# Altium schematic sheet P2_TOP.SchDoc
size A4; SheetNumber: 1; SheetTotal: 9
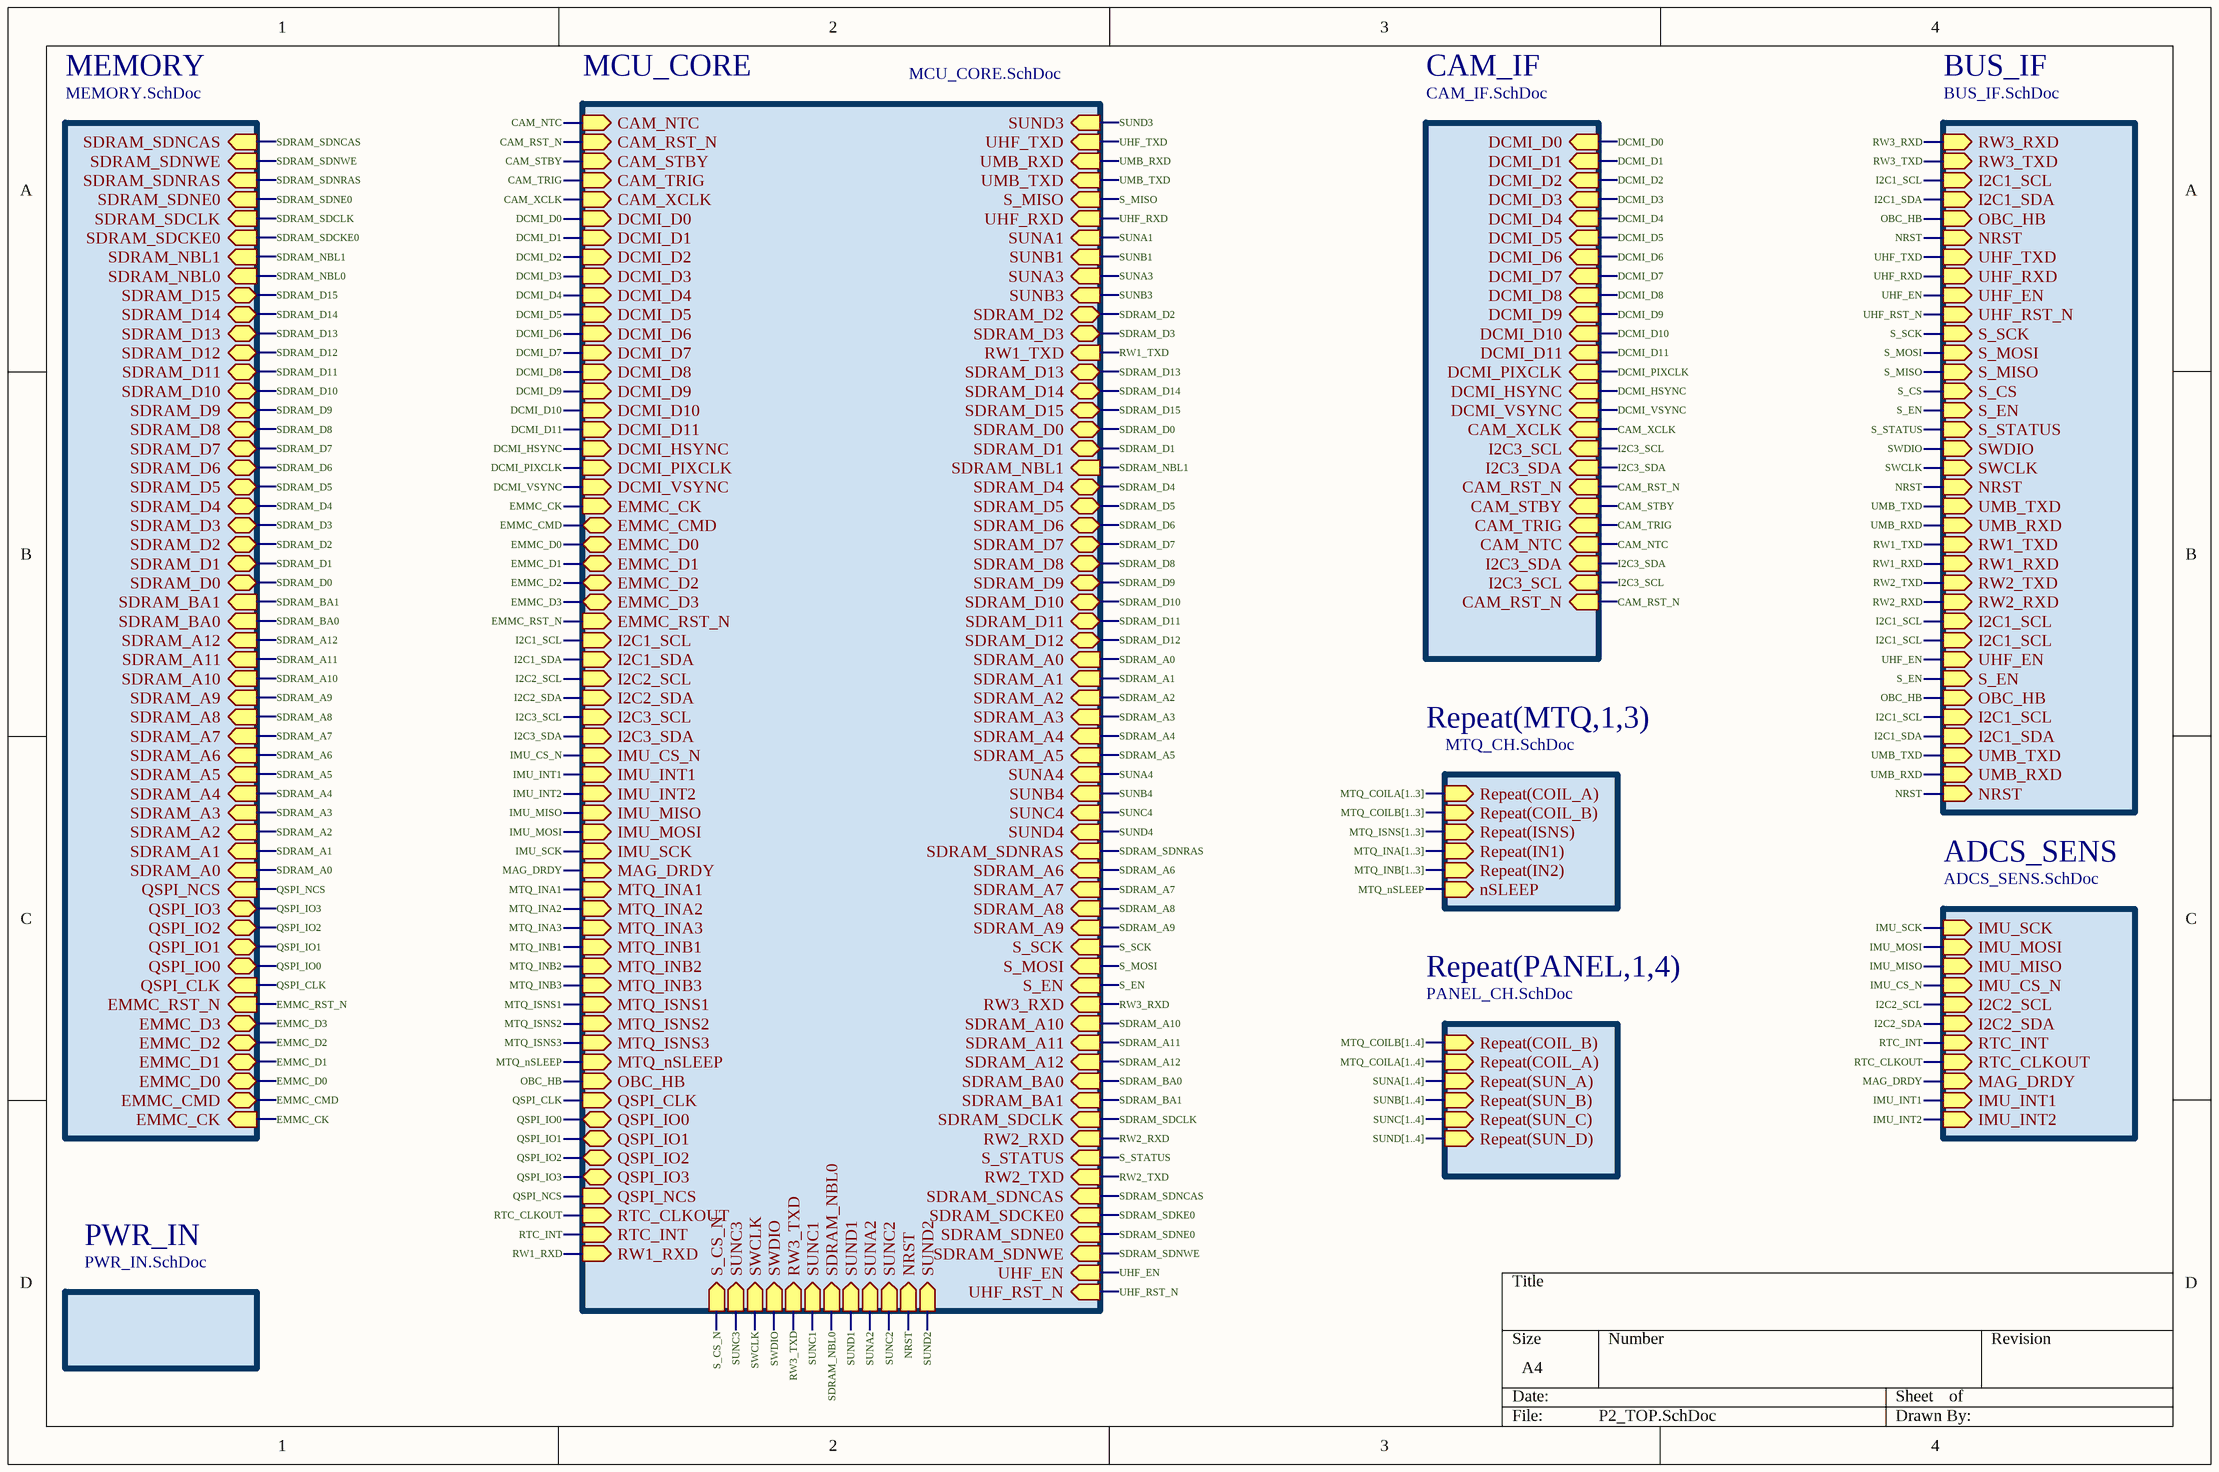
[diagram p0: P2_TOP.SchDoc]

## Sub-sheets
ADCS_SENS = ADCS_SENS.SchDoc: IMU_SCK (in), IMU_MOSI (in), IMU_MISO (in), IMU_CS_N (in), I2C2_SCL (in), I2C2_SDA (in), RTC_INT (in), RTC_CLKOUT (in), MAG_DRDY (in), IMU_INT1 (in), IMU_INT2 (in)
BUS_IF = BUS_IF.SchDoc: RW3_RXD (in), RW3_TXD (in), I2C1_SCL (in), I2C1_SDA (in), OBC_HB (in), NRST (in), UHF_TXD (in), UHF_RXD (in), UHF_EN (in), UHF_RST_N (in), S_SCK (in), S_MOSI (in), S_MISO (in), S_CS (in), S_EN (in), S_STATUS (in), SWDIO (in), SWCLK (in), NRST (in), UMB_TXD (in), UMB_RXD (in), RW1_TXD (in), RW1_RXD (in), RW2_TXD (in), RW2_RXD (in), I2C1_SCL (in), I2C1_SCL (in), UHF_EN (in), S_EN (in), OBC_HB (in), I2C1_SCL (in), I2C1_SDA (in), UMB_TXD (in), UMB_RXD (in), NRST (in)
CAM_IF = CAM_IF.SchDoc: DCMI_D0 (in), DCMI_D1 (in), DCMI_D2 (in), DCMI_D3 (in), DCMI_D4 (in), DCMI_D5 (in), DCMI_D6 (in), DCMI_D7 (in), DCMI_D8 (in), DCMI_D9 (in), DCMI_D10 (in), DCMI_D11 (in), DCMI_PIXCLK (in), DCMI_HSYNC (in), DCMI_VSYNC (in), CAM_XCLK (in), I2C3_SCL (in), I2C3_SDA (in), CAM_RST_N (in), CAM_STBY (in), CAM_TRIG (in), CAM_NTC (in), I2C3_SDA (in), I2C3_SCL (in), CAM_RST_N (in)
MCU_CORE = MCU_CORE.SchDoc: CAM_NTC (in), CAM_RST_N (in), CAM_STBY (in), CAM_TRIG (in), CAM_XCLK (in), DCMI_D0 (in), DCMI_D1 (in), DCMI_D2 (in), DCMI_D3 (in), DCMI_D4 (in), DCMI_D5 (in), DCMI_D6 (in), DCMI_D7 (in), DCMI_D8 (in), DCMI_D9 (in), DCMI_D10 (in), DCMI_D11 (in), DCMI_HSYNC (in), DCMI_PIXCLK (in), DCMI_VSYNC (in), EMMC_CK (in), EMMC_CMD (bidir), EMMC_D0 (bidir), EMMC_D1 (bidir), EMMC_D2 (bidir), EMMC_D3 (bidir), EMMC_RST_N (in), I2C1_SCL (in), I2C1_SDA (in), I2C2_SCL (in), I2C2_SDA (in), I2C3_SCL (in), I2C3_SDA (in), IMU_CS_N (in), IMU_INT1 (in), IMU_INT2 (in), IMU_MISO (in), IMU_MOSI (in), IMU_SCK (in), MAG_DRDY (in), MTQ_INA1 (in), MTQ_INA2 (in), MTQ_INA3 (in), MTQ_INB1 (in), MTQ_INB2 (in), MTQ_INB3 (in), MTQ_ISNS1 (in), MTQ_ISNS2 (in), MTQ_ISNS3 (in), MTQ_nSLEEP (in), SUND3 (in), UHF_TXD (in), UMB_RXD (in), UMB_TXD (in), S_MISO (in), UHF_RXD (in), SUNA1 (in), SUNB1 (in), SUNA3 (in), SUNB3 (in), SDRAM_D2 (bidir), SDRAM_D3 (bidir), RW1_TXD (in), SDRAM_D13 (bidir), SDRAM_D14 (bidir), SDRAM_D15 (bidir), SDRAM_D0 (bidir), SDRAM_D1 (bidir), SDRAM_NBL1 (in), SDRAM_D4 (bidir), SDRAM_D5 (bidir), SDRAM_D6 (bidir), SDRAM_D7 (bidir), SDRAM_D8 (bidir), SDRAM_D9 (bidir), SDRAM_D10 (bidir), SDRAM_D11 (bidir), SDRAM_D12 (bidir), SDRAM_A0 (in), SDRAM_A1 (in), SDRAM_A2 (in), SDRAM_A3 (in), SDRAM_A4 (in), SDRAM_A5 (in), SUNA4 (in), SUNB4 (in), SUNC4 (in), SUND4 (in), SDRAM_SDNRAS (in), SDRAM_A6 (in), SDRAM_A7 (in), SDRAM_A8 (in), SDRAM_A9 (in), S_SCK (in), S_MOSI (in), S_EN (in), RW3_RXD (in), SDRAM_A10 (in), SDRAM_A11 (in), SDRAM_A12 (in), SDRAM_BA0 (in), SDRAM_BA1 (in), SDRAM_SDCLK (in), RW2_RXD (in), S_STATUS (in), RW2_TXD (in), SDRAM_SDNCAS (in), SDRAM_SDCKE0 (in), SDRAM_SDNE0 (in), SDRAM_SDNWE (in), UHF_EN (in), UHF_RST_N (in), OBC_HB (in), QSPI_CLK (in), QSPI_IO0 (bidir), QSPI_IO1 (bidir), QSPI_IO2 (bidir), QSPI_IO3 (bidir), QSPI_NCS (in), RTC_CLKOUT (in), RTC_INT (in), RW1_RXD (in), SUNC1 (in), SDRAM_NBL0 (in), SUND1 (in), SUNA2 (in), SUNC2 (in), NRST (in), SUND2 (in), RW3_TXD (in), SWDIO (in), SWCLK (in), SUNC3 (in), S_CS_N (in)
MEMORY = MEMORY.SchDoc: SDRAM_SDNWE (in), SDRAM_SDNRAS (in), SDRAM_SDNE0 (in), SDRAM_SDCLK (in), SDRAM_SDCKE0 (in), SDRAM_NBL1 (in), SDRAM_NBL0 (in), SDRAM_D15 (bidir), SDRAM_D14 (bidir), SDRAM_D13 (bidir), SDRAM_D12 (bidir), SDRAM_D11 (bidir), SDRAM_D10 (bidir), SDRAM_D9 (bidir), SDRAM_D8 (bidir), SDRAM_D7 (bidir), SDRAM_D6 (bidir), SDRAM_D5 (bidir), SDRAM_D4 (bidir), SDRAM_D3 (bidir), SDRAM_D2 (bidir), SDRAM_D1 (bidir), SDRAM_D0 (bidir), SDRAM_BA1 (in), SDRAM_BA0 (in), SDRAM_A12 (in), SDRAM_A11 (in), SDRAM_A10 (in), SDRAM_A9 (in), SDRAM_A8 (in), SDRAM_A7 (in), SDRAM_A6 (in), SDRAM_A5 (in), SDRAM_A4 (in), SDRAM_A3 (in), SDRAM_A2 (in), SDRAM_A1 (in), SDRAM_A0 (in), QSPI_NCS (in), QSPI_IO3 (bidir), QSPI_IO2 (bidir), QSPI_IO1 (bidir), QSPI_IO0 (bidir), QSPI_CLK (in), EMMC_RST_N (in), EMMC_D3 (bidir), EMMC_D2 (bidir), EMMC_D1 (bidir), EMMC_D0 (bidir), EMMC_CK (in), EMMC_CMD (bidir), SDRAM_SDNCAS (in)
PWR_IN = PWR_IN.SchDoc: no entries
Repeat(MTQ,1,3) = MTQ_CH.SchDoc: Repeat(COIL_A) (in), Repeat(COIL_B) (in), Repeat(ISNS) (in), Repeat(IN1) (in), Repeat(IN2) (in), nSLEEP (in)
Repeat(PANEL,1,4) = PANEL_CH.SchDoc: Repeat(COIL_B) (in), Repeat(COIL_A) (in), Repeat(SUN_A) (in), Repeat(SUN_B) (in), Repeat(SUN_C) (in), Repeat(SUN_D) (in)

## Nets
CAM_NTC: sheet CAM_IF/CAM_NTC, sheet MCU_CORE/CAM_NTC
CAM_RST_N: sheet CAM_IF/CAM_RST_N, sheet CAM_IF/CAM_RST_N, sheet MCU_CORE/CAM_RST_N
CAM_STBY: sheet CAM_IF/CAM_STBY, sheet MCU_CORE/CAM_STBY
CAM_TRIG: sheet CAM_IF/CAM_TRIG, sheet MCU_CORE/CAM_TRIG
CAM_XCLK: sheet CAM_IF/CAM_XCLK, sheet MCU_CORE/CAM_XCLK
DCMI_D0: sheet CAM_IF/DCMI_D0, sheet MCU_CORE/DCMI_D0
DCMI_D1: sheet CAM_IF/DCMI_D1, sheet MCU_CORE/DCMI_D1
DCMI_D2: sheet CAM_IF/DCMI_D2, sheet MCU_CORE/DCMI_D2
DCMI_D3: sheet CAM_IF/DCMI_D3, sheet MCU_CORE/DCMI_D3
DCMI_D4: sheet CAM_IF/DCMI_D4, sheet MCU_CORE/DCMI_D4
DCMI_D5: sheet CAM_IF/DCMI_D5, sheet MCU_CORE/DCMI_D5
DCMI_D6: sheet CAM_IF/DCMI_D6, sheet MCU_CORE/DCMI_D6
DCMI_D7: sheet CAM_IF/DCMI_D7, sheet MCU_CORE/DCMI_D7
DCMI_D8: sheet CAM_IF/DCMI_D8, sheet MCU_CORE/DCMI_D8
DCMI_D9: sheet CAM_IF/DCMI_D9, sheet MCU_CORE/DCMI_D9
DCMI_D10: sheet CAM_IF/DCMI_D10, sheet MCU_CORE/DCMI_D10
DCMI_D11: sheet CAM_IF/DCMI_D11, sheet MCU_CORE/DCMI_D11
DCMI_HSYNC: sheet CAM_IF/DCMI_HSYNC, sheet MCU_CORE/DCMI_HSYNC
DCMI_PIXCLK: sheet CAM_IF/DCMI_PIXCLK, sheet MCU_CORE/DCMI_PIXCLK
DCMI_VSYNC: sheet CAM_IF/DCMI_VSYNC, sheet MCU_CORE/DCMI_VSYNC
EMMC_CK: sheet MEMORY/EMMC_CK, sheet MCU_CORE/EMMC_CK
EMMC_CMD: sheet MEMORY/EMMC_CMD, sheet MCU_CORE/EMMC_CMD
EMMC_D0: sheet MEMORY/EMMC_D0, sheet MCU_CORE/EMMC_D0
EMMC_D1: sheet MEMORY/EMMC_D1, sheet MCU_CORE/EMMC_D1
EMMC_D2: sheet MEMORY/EMMC_D2, sheet MCU_CORE/EMMC_D2
EMMC_D3: sheet MEMORY/EMMC_D3, sheet MCU_CORE/EMMC_D3
EMMC_RST_N: sheet MEMORY/EMMC_RST_N, sheet MCU_CORE/EMMC_RST_N
I2C1_SCL: sheet MCU_CORE/I2C1_SCL, sheet BUS_IF/I2C1_SCL, sheet BUS_IF/I2C1_SCL, sheet BUS_IF/I2C1_SCL, sheet BUS_IF/I2C1_SCL
I2C1_SDA: sheet MCU_CORE/I2C1_SDA, sheet BUS_IF/I2C1_SDA, sheet BUS_IF/I2C1_SDA
I2C2_SCL: sheet MCU_CORE/I2C2_SCL, sheet ADCS_SENS/I2C2_SCL
I2C2_SDA: sheet MCU_CORE/I2C2_SDA, sheet ADCS_SENS/I2C2_SDA
I2C3_SCL: sheet CAM_IF/I2C3_SCL, sheet CAM_IF/I2C3_SCL, sheet MCU_CORE/I2C3_SCL
I2C3_SDA: sheet CAM_IF/I2C3_SDA, sheet CAM_IF/I2C3_SDA, sheet MCU_CORE/I2C3_SDA
IMU_CS_N: sheet MCU_CORE/IMU_CS_N, sheet ADCS_SENS/IMU_CS_N
IMU_INT1: sheet MCU_CORE/IMU_INT1, sheet ADCS_SENS/IMU_INT1
IMU_INT2: sheet MCU_CORE/IMU_INT2, sheet ADCS_SENS/IMU_INT2
IMU_MISO: sheet MCU_CORE/IMU_MISO, sheet ADCS_SENS/IMU_MISO
IMU_MOSI: sheet MCU_CORE/IMU_MOSI, sheet ADCS_SENS/IMU_MOSI
IMU_SCK: sheet MCU_CORE/IMU_SCK, sheet ADCS_SENS/IMU_SCK
MAG_DRDY: sheet MCU_CORE/MAG_DRDY, sheet ADCS_SENS/MAG_DRDY
MTQ_INA1: sheet MCU_CORE/MTQ_INA1
MTQ_INA2: sheet MCU_CORE/MTQ_INA2
MTQ_INA3: sheet MCU_CORE/MTQ_INA3
MTQ_INB1: sheet MCU_CORE/MTQ_INB1
MTQ_INB2: sheet MCU_CORE/MTQ_INB2
MTQ_INB3: sheet MCU_CORE/MTQ_INB3
MTQ_ISNS1: sheet MCU_CORE/MTQ_ISNS1
MTQ_ISNS2: sheet MCU_CORE/MTQ_ISNS2
MTQ_ISNS3: sheet MCU_CORE/MTQ_ISNS3
MTQ_nSLEEP: sheet MCU_CORE/MTQ_nSLEEP, sheet Repeat(MTQ,1,3)/nSLEEP
NRST: sheet MCU_CORE/NRST, sheet BUS_IF/NRST, sheet BUS_IF/NRST, sheet BUS_IF/NRST
OBC_HB: sheet MCU_CORE/OBC_HB, sheet BUS_IF/OBC_HB, sheet BUS_IF/OBC_HB
QSPI_CLK: sheet MEMORY/QSPI_CLK, sheet MCU_CORE/QSPI_CLK
QSPI_IO0: sheet MEMORY/QSPI_IO0, sheet MCU_CORE/QSPI_IO0
QSPI_IO1: sheet MEMORY/QSPI_IO1, sheet MCU_CORE/QSPI_IO1
QSPI_IO2: sheet MEMORY/QSPI_IO2, sheet MCU_CORE/QSPI_IO2
QSPI_IO3: sheet MEMORY/QSPI_IO3, sheet MCU_CORE/QSPI_IO3
QSPI_NCS: sheet MEMORY/QSPI_NCS, sheet MCU_CORE/QSPI_NCS
RTC_CLKOUT: sheet MCU_CORE/RTC_CLKOUT, sheet ADCS_SENS/RTC_CLKOUT
RTC_INT: sheet MCU_CORE/RTC_INT, sheet ADCS_SENS/RTC_INT
RW1_RXD: sheet MCU_CORE/RW1_RXD, sheet BUS_IF/RW1_RXD
RW1_TXD: sheet MCU_CORE/RW1_TXD, sheet BUS_IF/RW1_TXD
RW2_RXD: sheet MCU_CORE/RW2_RXD, sheet BUS_IF/RW2_RXD
RW2_TXD: sheet MCU_CORE/RW2_TXD, sheet BUS_IF/RW2_TXD
RW3_RXD: sheet MCU_CORE/RW3_RXD, sheet BUS_IF/RW3_RXD
RW3_TXD: sheet MCU_CORE/RW3_TXD, sheet BUS_IF/RW3_TXD
S_CS: sheet BUS_IF/S_CS
S_CS_N: sheet MCU_CORE/S_CS_N
S_EN: sheet MCU_CORE/S_EN, sheet BUS_IF/S_EN, sheet BUS_IF/S_EN
S_MISO: sheet MCU_CORE/S_MISO, sheet BUS_IF/S_MISO
S_MOSI: sheet MCU_CORE/S_MOSI, sheet BUS_IF/S_MOSI
S_SCK: sheet MCU_CORE/S_SCK, sheet BUS_IF/S_SCK
S_STATUS: sheet MCU_CORE/S_STATUS, sheet BUS_IF/S_STATUS
SDRAM_A0: sheet MEMORY/SDRAM_A0, sheet MCU_CORE/SDRAM_A0
SDRAM_A1: sheet MEMORY/SDRAM_A1, sheet MCU_CORE/SDRAM_A1
SDRAM_A2: sheet MEMORY/SDRAM_A2, sheet MCU_CORE/SDRAM_A2
SDRAM_A3: sheet MEMORY/SDRAM_A3, sheet MCU_CORE/SDRAM_A3
SDRAM_A4: sheet MEMORY/SDRAM_A4, sheet MCU_CORE/SDRAM_A4
SDRAM_A5: sheet MEMORY/SDRAM_A5, sheet MCU_CORE/SDRAM_A5
SDRAM_A6: sheet MEMORY/SDRAM_A6, sheet MCU_CORE/SDRAM_A6
SDRAM_A7: sheet MEMORY/SDRAM_A7, sheet MCU_CORE/SDRAM_A7
SDRAM_A8: sheet MEMORY/SDRAM_A8, sheet MCU_CORE/SDRAM_A8
SDRAM_A9: sheet MEMORY/SDRAM_A9, sheet MCU_CORE/SDRAM_A9
SDRAM_A10: sheet MEMORY/SDRAM_A10, sheet MCU_CORE/SDRAM_A10
SDRAM_A11: sheet MEMORY/SDRAM_A11, sheet MCU_CORE/SDRAM_A11
SDRAM_A12: sheet MEMORY/SDRAM_A12, sheet MCU_CORE/SDRAM_A12
SDRAM_BA0: sheet MEMORY/SDRAM_BA0, sheet MCU_CORE/SDRAM_BA0
SDRAM_BA1: sheet MEMORY/SDRAM_BA1, sheet MCU_CORE/SDRAM_BA1
SDRAM_D0: sheet MEMORY/SDRAM_D0, sheet MCU_CORE/SDRAM_D0
SDRAM_D1: sheet MEMORY/SDRAM_D1, sheet MCU_CORE/SDRAM_D1
SDRAM_D2: sheet MEMORY/SDRAM_D2, sheet MCU_CORE/SDRAM_D2
SDRAM_D3: sheet MEMORY/SDRAM_D3, sheet MCU_CORE/SDRAM_D3
SDRAM_D4: sheet MEMORY/SDRAM_D4, sheet MCU_CORE/SDRAM_D4
SDRAM_D5: sheet MEMORY/SDRAM_D5, sheet MCU_CORE/SDRAM_D5
SDRAM_D6: sheet MEMORY/SDRAM_D6, sheet MCU_CORE/SDRAM_D6
SDRAM_D7: sheet MEMORY/SDRAM_D7, sheet MCU_CORE/SDRAM_D7
SDRAM_D8: sheet MEMORY/SDRAM_D8, sheet MCU_CORE/SDRAM_D8
SDRAM_D9: sheet MEMORY/SDRAM_D9, sheet MCU_CORE/SDRAM_D9
SDRAM_D10: sheet MEMORY/SDRAM_D10, sheet MCU_CORE/SDRAM_D10
SDRAM_D11: sheet MEMORY/SDRAM_D11, sheet MCU_CORE/SDRAM_D11
SDRAM_D12: sheet MEMORY/SDRAM_D12, sheet MCU_CORE/SDRAM_D12
SDRAM_D13: sheet MEMORY/SDRAM_D13, sheet MCU_CORE/SDRAM_D13
SDRAM_D14: sheet MEMORY/SDRAM_D14, sheet MCU_CORE/SDRAM_D14
SDRAM_D15: sheet MEMORY/SDRAM_D15, sheet MCU_CORE/SDRAM_D15
SDRAM_NBL0: sheet MEMORY/SDRAM_NBL0, sheet MCU_CORE/SDRAM_NBL0
SDRAM_NBL1: sheet MEMORY/SDRAM_NBL1, sheet MCU_CORE/SDRAM_NBL1
SDRAM_SDCKE0: sheet MEMORY/SDRAM_SDCKE0
SDRAM_SDCLK: sheet MEMORY/SDRAM_SDCLK, sheet MCU_CORE/SDRAM_SDCLK
SDRAM_SDKE0: sheet MCU_CORE/SDRAM_SDCKE0
SDRAM_SDNCAS: sheet MEMORY/SDRAM_SDNCAS, sheet MCU_CORE/SDRAM_SDNCAS
SDRAM_SDNE0: sheet MEMORY/SDRAM_SDNE0, sheet MCU_CORE/SDRAM_SDNE0
SDRAM_SDNRAS: sheet MEMORY/SDRAM_SDNRAS, sheet MCU_CORE/SDRAM_SDNRAS
SDRAM_SDNWE: sheet MEMORY/SDRAM_SDNWE, sheet MCU_CORE/SDRAM_SDNWE
SUNA1: sheet MCU_CORE/SUNA1
SUNA2: sheet MCU_CORE/SUNA2
SUNA3: sheet MCU_CORE/SUNA3
SUNA4: sheet MCU_CORE/SUNA4
SUNB1: sheet MCU_CORE/SUNB1
SUNB3: sheet MCU_CORE/SUNB3
SUNB4: sheet MCU_CORE/SUNB4
SUNC1: sheet MCU_CORE/SUNC1
SUNC2: sheet MCU_CORE/SUNC2
SUNC3: sheet MCU_CORE/SUNC3
SUNC4: sheet MCU_CORE/SUNC4
SUND1: sheet MCU_CORE/SUND1
SUND2: sheet MCU_CORE/SUND2
SUND3: sheet MCU_CORE/SUND3
SUND4: sheet MCU_CORE/SUND4
SWCLK: sheet MCU_CORE/SWCLK, sheet BUS_IF/SWCLK
SWDIO: sheet MCU_CORE/SWDIO, sheet BUS_IF/SWDIO
UHF_EN: sheet MCU_CORE/UHF_EN, sheet BUS_IF/UHF_EN, sheet BUS_IF/UHF_EN
UHF_RST_N: sheet MCU_CORE/UHF_RST_N, sheet BUS_IF/UHF_RST_N
UHF_RXD: sheet MCU_CORE/UHF_RXD, sheet BUS_IF/UHF_RXD
UHF_TXD: sheet MCU_CORE/UHF_TXD, sheet BUS_IF/UHF_TXD
UMB_RXD: sheet MCU_CORE/UMB_RXD, sheet BUS_IF/UMB_RXD, sheet BUS_IF/UMB_RXD
UMB_TXD: sheet MCU_CORE/UMB_TXD, sheet BUS_IF/UMB_TXD, sheet BUS_IF/UMB_TXD

## Buses and harness runs
bus MTQ_COILA[1..3] = sheet Repeat(MTQ,1,3)/Repeat(COIL_A)
bus MTQ_COILA[1..4] = sheet Repeat(PANEL,1,4)/Repeat(COIL_A)
bus MTQ_COILB[1..3] = sheet Repeat(MTQ,1,3)/Repeat(COIL_B)
bus MTQ_COILB[1..4] = sheet Repeat(PANEL,1,4)/Repeat(COIL_B)
bus MTQ_INA[1..3] = sheet Repeat(MTQ,1,3)/Repeat(IN1)
bus MTQ_INB[1..3] = sheet Repeat(MTQ,1,3)/Repeat(IN2)
bus MTQ_ISNS[1..3] = sheet Repeat(MTQ,1,3)/Repeat(ISNS)
bus SUNA[1..4] = sheet Repeat(PANEL,1,4)/Repeat(SUN_A)
bus SUNB[1..4] = sheet Repeat(PANEL,1,4)/Repeat(SUN_B)
bus SUNC[1..4] = sheet Repeat(PANEL,1,4)/Repeat(SUN_C)
bus SUND[1..4] = sheet Repeat(PANEL,1,4)/Repeat(SUN_D)